# Altium schematic sheet sensors.SchDoc
size A4; SheetNumber: 2; SheetTotal: 2
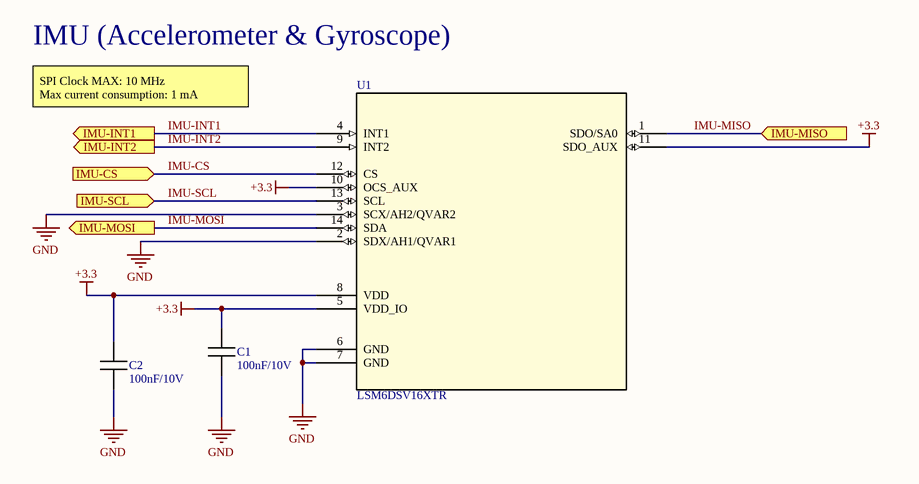
[diagram p0: sensors.SchDoc]

## Parts
C1  value 100nF/10V  [Capacitor_0805]  (hidden comment: Capacitor)
C2  value 100nF/10V  [Capacitor_0805]  (hidden comment: Capacitor)
U1  LSM6DSV16XTR  [LGA-14L_STM]

## Ports
IMU-CS (in, see Main[3C]), IMU-INT1 (out, see Main[3C]), IMU-INT2 (out, see Main[3C]), IMU-MISO (in, see Main[3C]), IMU-MOSI (out, see Main[3C]), IMU-SCL (in, see Main[3C])

## Nets
+3.3: C1.1 C2.1 U1.5(VDD_IO) U1.8(VDD) U1.10(OCS_AUX) U1.11(SDO_AUX)
GND: C1.0 C2.0 U1.2(SDX/AH1/QVAR1) U1.3(SCX/AH2/QVAR2) U1.6(GND) U1.7(GND)
IMU-CS: U1.12(CS) ; port IMU-CS
IMU-INT1: U1.4(INT1) ; port IMU-INT1
IMU-INT2: U1.9(INT2) ; port IMU-INT2
IMU-MISO: U1.1(SDO/SA0) ; port IMU-MISO
IMU-MOSI: U1.14(SDA) ; port IMU-MOSI
IMU-SCL: U1.13(SCL) ; port IMU-SCL

## Notes on the sheet
- IMU (Accelerometer & Gyroscope)
- SPI Clock MAX: 10 MHz
  Max current consumption: 1 mA

## Library data of the parts
C1 C2 = d5545c32-35b3-4590-a9f7-320b11ab5976: Part Number: Capacitor SMD 0805 100nF/10V; UUID: d5545c32-35b3-4590-a9f7-320b11ab5976; Availability: 0
U1 = 42eb7ce3-c8ef-4d56-9a68-980b0afe7d6a: 6-axis inertial measurement unit (IMU) with embedded AI and sensor fusion, Qvar for high-end applications; Manufacturer_Name: STMicroelectronics; Tags: imu, project_joycons; Copyright: Copyright (C) 2025 Ultra Librarian. All rights reserved.; Manufacturer_Part_Number: LSM6DSV16XTR; RefDes: RefDes; Type: Type; UUID: 42eb7ce3-c8ef-4d56-9a68-980b0afe7d6a; Part Number: LSM6DSV16XTR; Manufacturer: STMicroelectronics; Availability: 0; Supplier (Mouser): 511-LSM6DSV16XTR; Supplier (LCSC Electronics): C5267406